# Altium schematic sheet 08_30_TIME_GNSS.SchDoc
size 289 x 396 mm
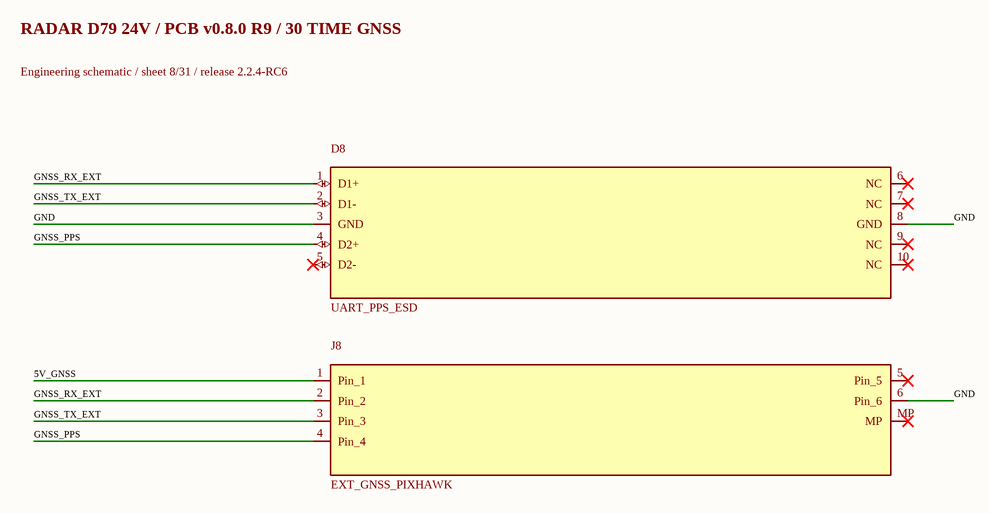
[diagram p0: 08_30_TIME_GNSS.SchDoc]

## Parts
D8  UART_PPS_ESD  [USON-10_2.5x1.0mm_P0.5mm]
J8  EXT_GNSS_PIXHAWK  [JST_GH_SM06B-GHS-TB_1x06-1MP_P1.25mm_Horizontal]

## Nets
5V_GNSS: J8.1(Pin_1)
GND: D8.3(GND) D8.8(GND) J8.6(Pin_6)
GNSS_PPS: D8.4(D2+) J8.4(Pin_4)
GNSS_RX_EXT: D8.1(D1+) J8.2(Pin_2)
GNSS_TX_EXT: D8.2(D1-) J8.3(Pin_3)

Not connected (* = marked no-connect by the designer): D8 5(D2-)* 6(NC)* 7(NC)* 9(NC)* 10(NC)*; J8 5(Pin_5)* MP*

## Notes on the sheet
- RADAR D79 24V / PCB v0.8.0 R9 / 30 TIME GNSS
- Engineering schematic / sheet 8/31 / release 2.2.4-RC6